# Altium project LLR-05U (Main-Board).PrjPcb
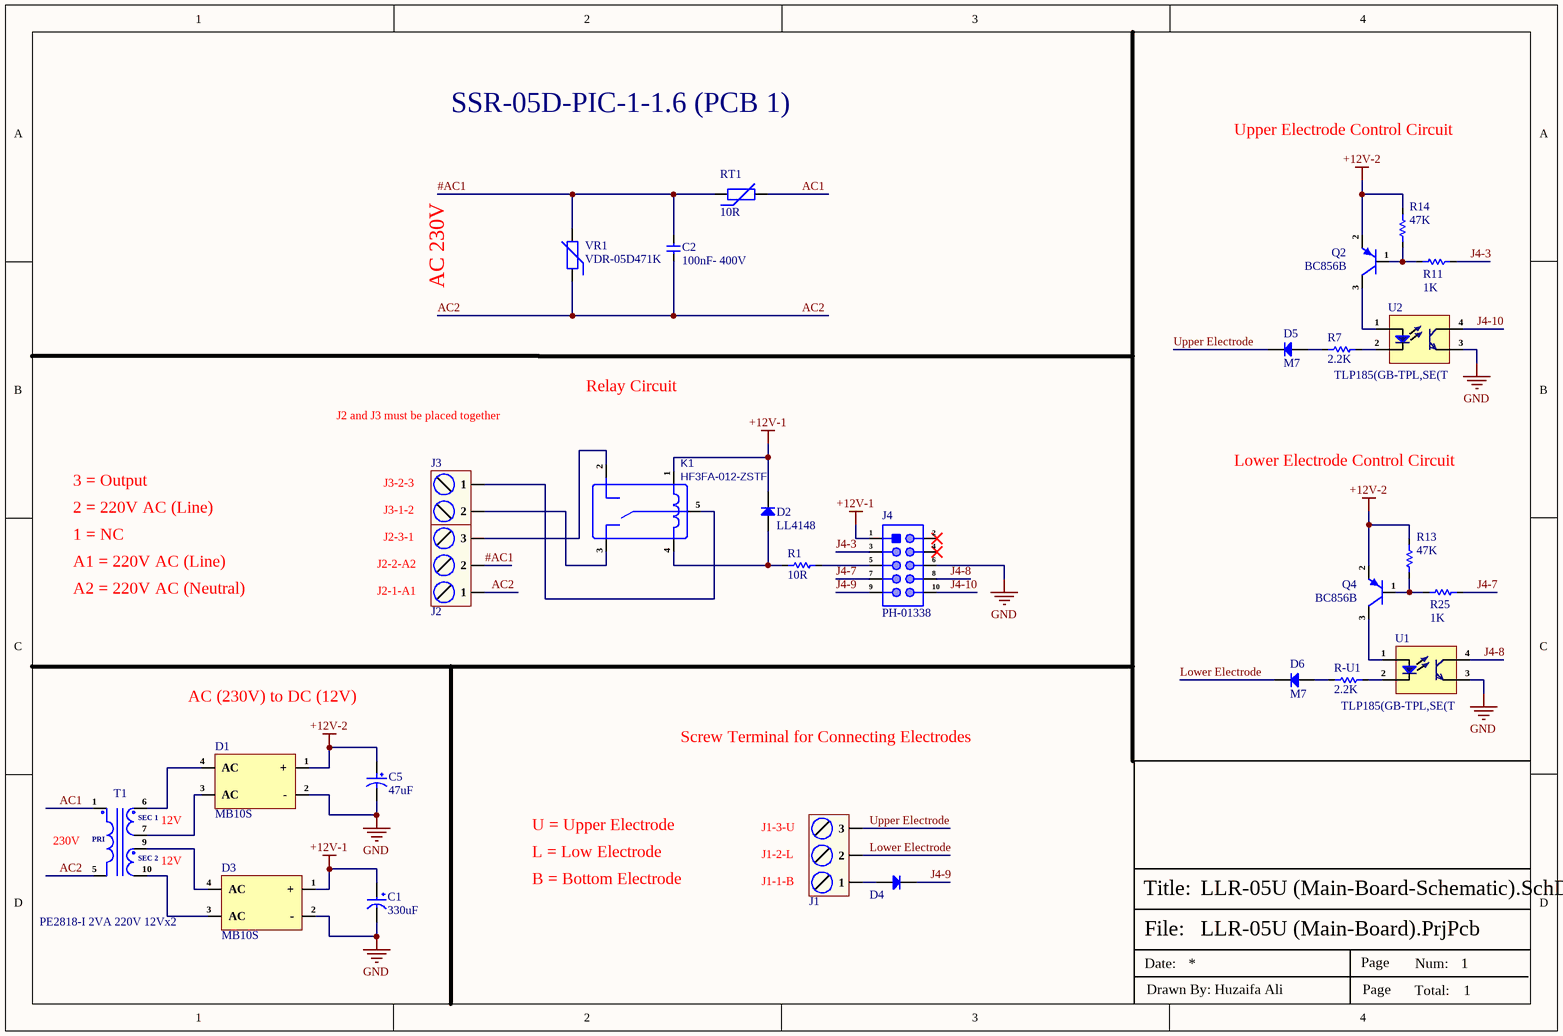
[diagram p0: LLR-05U (Main-Board-Schematic).SchDoc]
1 sheet, 28 parts. Net scope: global (net labels, ports and power ports of the same name join across sheets).
Board file: LLR-05U (Main-Board-PCB).PcbDoc

## Sheet LLR-05U (Main-Board-Schematic).SchDoc
size A4; SheetNumber: 1; SheetTotal: 1

### Parts
C1  330uF  [RC035M331LO8*14TH-2A1E]
C2  100nF- 400V  [82CL0114]
C5  47uF  [Plugin,D6.3xL12mm]
D1  MB10S  [MBS10S]
D2  LL4148  [LL-34]
D3  MB10S  [MBS10S]
D4  M7  [SMA(DO-214AC)]  (value not drawn)
D5  M7  [SMA(DO-214AC)]
D6  M7  [SMA(DO-214AC)]
J1  KF129-5.08-3P  [KF129-5.08-3P]  (value not drawn)
J2  KF129-5.08-3P  [KF129-5.08-3P]  (value not drawn)
J3  KF129-5.08-2P  [KF129-5.08-2P]  (value not drawn)
J4  PH-01338  [PH-01338]
K1  HF3FA-012-ZSTF  [HF3FA-012-ZSTF]
Q2  BC856B  [SOT-23]
Q4  BC856B  [SOT-23]
R1  10R  [RES-0805]
R7  2.2K  [Res-1206]
R11  1K  [Res-0603]
R13  47K  [Res-0603]
R14  47K  [Res-0603]
R25  1K  [Res-0603]
R-U1  2.2K  [Res-1206]
RT1  10R  [10D-9]
T1  PE2818-I 2VA 220V 12Vx2  [PE2818-I]
U1  TLP185(GB-TPL,SE(T  [SOP-4_2.54]
U2  TLP185(GB-TPL,SE(T  [SOP-4_2.54]
VR1  VDR-05D471K  [VDR-05D471K]

### Nets
+12V-1: C1.1 D2.1(K) D3.1(+) J4.1 K1.1
+12V-2: C5.1 D1.1(+) Q2.2(E) Q4.2(E) R13.2 R14.1
GND: C1.2 C5.2 D1.2(-) D3.2(-) J4.6 U1.3(E) U2.3(E)
#AC1: C2.2 J2.2 RT1.1 VR1.2
AC1: RT1.2 T1.1
AC2: C2.1 J2.1 T1.5 VR1.1
J4-3: J4.3 R11.2
J4-7: J4.7 R25.1
J4-8: J4.8 U1.4(C)
J4-9: D4.1(K) J4.9
J4-10: J4.10 U2.4(C)
Lower Electrode: D6.1(K) J1.2
Upper Electrode: D5.1(K) J1.3
NetD1_3: D1.3(AC) T1.7
NetD1_4: D1.4(AC) T1.6
NetD2_2: D2.2(A) K1.4 R1.2
NetD3_3: D3.3(AC) T1.10
NetD3_4: D3.4(AC) T1.9
NetD4_2: D4.2(A) J1.1
NetD5_2: D5.2(A) R7.1
NetD6_2: D6.2(A) R-U1.1
NetJ2_3: J2.3 K1.2
NetJ3_1: J3.1 K1.5
NetJ3_2: J3.2 K1.3
NetJ4_5: J4.5 R1.1
NetQ2_1: Q2.1(B) R11.1 R14.2
NetQ2_3: Q2.3(C) U2.1(An)
NetQ4_1: Q4.1(B) R13.1 R25.2
NetQ4_3: Q4.3(C) U1.1(An)
NetR7_2: R7.2 U2.2(Ca)
NetR-U1_2: R-U1.2 U1.2(Ca)

Not connected (* = marked no-connect by the designer): J4 2* 4*

### Notes on the sheet
- SSR-05D-PIC-1-1.6 (PCB 1)
- Upper Electrode Control Circuit
- AC 230V
- J2 and J3 must be placed together
- Relay Circuit
- 2 = 220V AC (Line)
- 3 = Output
- J3-1-2
- J3-2-3
- Lower Electrode Control Circuit
- A1 = 220V AC (Line)
- 1 = NC
- J2-2-A2
- J2-3-1
- A2 = 220V AC (Neutral)
- (near J2) J2-1-A1
- AC (230V) to DC (12V)
- Screw Terminal for Connecting Electrodes
- (near T1) 230V
- 12V
- U = Upper Electrode
- (near J1) J1-3-U
- (near T1) 12V
- L = Low Electrode
- B = Bottom Electrode
- (near J1) J1-2-L
- (near J1) J1-1-B
- File:
- Title:
- Date:
- Page
- Num:
- Total:
- Drawn By: Huzaifa Ali
- (in symbol PE2818-I 2VA 220V 12Vx2) SEC 1; PRI; SEC 2

### Library data of the parts
C1 = RC035M331LO8*14TH-2A1E: 330uF 35V ±20% 860mA@100kHz Plugin,D8xL14mm Aluminum Electrolytic Capacitors - Leaded ROHS; Manufacturer: BERYL Electronic Tech; Manufacturer Part Number: RC035M331LO8*14TH-2A1E; Package: Plugin,D8xL14mm; LCSC Part Number: C357626; Item Type: Capacitor; ComponentLink1Description: LCSC; ComponentLink1URL: https://www.lcsc.com/product-detail/Aluminum-Electrolytic-Capacitors-Leaded_BERYL-Electronic-Tech-RC035M331LO8-14TH-2A1E_C357626.html
C2 = 82CL0114: 5% 400V 100nF PET Plugin,P=7.5mm Film Capacitors ROHS; Manufacturer: KNSCHA; Manufacturer Part Number: 82CL0114; Package: Plugin,P=7.5mm; LCSC Part Number: C5359295; ComponentLink1Description: LCSC; ComponentLink1URL: https://www.lcsc.com/product-detail/Film-Capacitors_KNSCHA-82CL0114_C5359295.html
C5 = 03EC0571: 47uF 50V ±20% 180mA@100kHz Plugin,D6.3xL12mm Aluminum Electrolytic Capacitors - Leaded ROHS; Manufacturer: KNSCHA; Manufacturer Part Number: 03EC0571; Package: Plugin,D6.3xL12mm; LCSC Part Number: C2831773; Item Type: Capacitor; ComponentLink1Description: LCSC; ComponentLink1URL: https://www.lcsc.com/product-detail/Aluminum-Electrolytic-Capacitors-Leaded_KNSCHA-03EC0571_C2831773.html
D1 D3 = MB10S: 35A 1.1V@400mA 1A 1kV MBS Bridge Rectifiers ROHS; Manufacturer: MDD; Manufacturer Part Number: MB10S; Package: MBS; JLCPCB Part Number: C2488; Item Type: Bridge Rectifier; ComponentLink1Description: LCSC; ComponentLink1URL: https://www.lcsc.com/product-detail/Bridge-Rectifiers_MCC_MB6S-TP_MB6S-TP_C85619.html?gclid=CjwKCAjwjOunBhB4EiwA94JWsPhP5VxdRhkKtNAXxaeRo8Kbw1z5VNRY74bvbkYd4a4LtLXYHGrsEhoCPX4QAvD_BwE
D2 = LL4148: 75V 1V@10mA 4ns 200mA LL-34 Switching Diode ROHS; Manufacturer: MDD; Manufacturer Part Number: LL4148; Package: LL-34; LCSC Part Number: C435829; Item Type: Diode; ComponentLink1Description: LCSC; ComponentLink1URL: https://www.lcsc.com/product-detail/Switching-Diode_MDD-Microdiode-Electronics-LL4148_C435829.html
D4-D6 = M7: 1A 1.1V@1A 1kV DO-214AC Diodes - General Purpose ROHS; Manufacturer: MSKSEMI; Item Type: Diode; Manufacturer Part Number: M7; Package: DO-214AC; LCSC Part Number: C2902910; ComponentLink1Description: LCSC; ComponentLink1URL: https://www.lcsc.com/product-detail/Diodes-General-Purpose_MSKSEMI-M7_C2902910.html
J1 J2 = KF129-5.08-3P: 1x3P 24A -40℃~+105℃ 250V Green 12~24 Straight 5.08mm 2.5 1 3 Plugin,P=5.08mm Screw terminal ROHS; Manufacturer: CiXi KaiFeng Electronics; Supplier: LCSC; LCSC Part Number: C475093; Manufacturer Part Number: KF129-5.08-3P; RoHS: No; Item Type: Screw Terminal
J3 = KF129-5.08-2P: 1x2P 24A -40℃~+105℃ 250V Green 12~24 Straight 5.08mm 2.5 1 2 Plugin,P=5.08mm Screw terminal ROHS; Manufacturer: CiXi KaiFeng Electronics; Supplier: LCSC; LCSC Part Number: C475092; Manufacturer Part Number: KF129-5.08-2P; RoHS: No; Item Type: Screw terminal
J4 = PH-01338: 3A Straight Square Pins 10P 3mm -40℃~+105℃ 3mm 2.54mm 双排 Black 2x5P 2.54mm Plugin,P=2.54mm Pin Headers ROHS; Manufacturer: Liansheng; Manufacturer Part Number: PH-01338; Package: Plugin,P=2.54mm; LCSC Part Number: C2685218; Item Type: Pin Header; ComponentLink1Description: LCSC; ComponentLink1URL: https://www.lcsc.com/product-detail/Pin-Headers_Liansheng-PH-01338_C2685218.html
K1 = HF3FA-012-ZSTF: 12V SPDT (1 Form C) Plugin,15.2x19mm Power Relays ROHS; Manufacturer: HF(宏发); Item Type: Relay; Supplier: LCSC; LCSC Part Number: C190455; Manufacturer Part: HF3FA-012-ZSTF
Q2 Q4 = BC856B: 65V 200mW 220@2mA,5V 100mA PNP SOT-23 Bipolar Transistors - BJT ROHS; Manufacturer: Guangdong Hottech; Manufacturer Part Number: BC856B; Package: SOT-23; LCSC Part Number: C181144; Item Type: Transistors; ComponentLink1Description: LCSC; ComponentLink1URL: https://www.lcsc.com/product-detail/Bipolar-Transistors-BJT_Guangdong-Hottech-BC856B_C181144.html
R1 = 0805W8F100JT5E: 125mW Thick Film Resistors 150V ±1% ±200ppm/℃ 10Ω 0805 Chip Resistor - Surface Mount ROHS; Manufacturer: Royal Electronic Factory; Supplier: Mouser; LCSC Part Number: C17415; Manufacturer Part Number: 0805W8F100JT5E; RoHS: No; Item Type: Resistor; Stock: 270000; Pricing: 10000=0.002 (USD); Value: 10R
R7 R-U1 = 1206W4F2201T5E: 250mW Thick Film Resistors 200V ±100ppm/℃ ±1% 2.2kΩ 1206 Chip Resistor - Surface Mount ROHS; Manufacturer: Uniroyal; Supplier: LCSC; LCSC Part Number: C17948; Manufacturer Part Number: 1206W4F2201T5E; RoHS: Yes; Category: LDO; RoHS Compliant: Yes; Item Type: Resistor
R11 R25 = RT0603BRD071KL: RES SMD 1K OHM 0.1% 1/10W 0603; Manufacturer: Yageo; Resistance: 1kR; Power Rating: 100mW; Voltage Rating: 75V; Temperature Coefficient: 25ppm/°C; Voltage Rating (DC): 50V; Item Type: Resistor; Supplier 1: Arrow Electronics; Manufacturer Part Number: RT0603BRD071KL; RoHS: Yes; Category: Chip SMD Resistors; Stock 1: 130000; Pricing 1: 5000=0.03900, 10000=0.03450, 25000=0.03070, 50000=0.02040 (USD); Mount: Surface Mount; Case/Package: 0603; Case Code (Metric): 1608; Case Code (Imperial): 0603; Contact Plating: Tin,Lead; Size Code: 0603; Min Operating Temperature: -55°C; Max Operating Temperature: 125°C; Package Quantity: 5000; Packaging: Tape and Reel; Resistor Type: Thin Film; Number of Terminations: 2; Termination: SMD/SMT; Max Power Dissipation: 100mW; Features: Moisture Resistant; Series: RT; Technology: THIN FILM; Construction: Rectangular; Length: 1.6mm; Width: 0.031inch; Height: 0.022inch; Depth: 0.8mm; Military Standard: Not; Lead Free: Lead Free; RoHS Compliant: Yes; ComponentLink1URL: https://datasheet.ciiva.com/11819/0900766b8079c86e-11819652.pdf?src-supplier=RSComponents; ComponentLink1Description: https://datasheet.ciiva.com/11819/0900766b8079c86e-11819652.pdf?src-supplier=RSComponents; ComponentLink2URL: https://datasheet.ciiva.com/5624/pyu-rt-1-to-0-05-rohs-l-4-5624759.pdf?src-supplier=Mouser; ComponentLink2Description: https://datasheet.ciiva.com/5624/pyu-rt-1-to-0-05-rohs-l-4-5624759.pdf?src-supplier=Mouser; ComponentLink3URL: https://datasheet.ciiva.com/29718/pyu-rt-1-to-0-05-rohs-l-4-29718010.pdf?src-supplier=Digi-Key; ComponentLink3Description: https://datasheet.ciiva.com/29718/pyu-rt-1-to-0-05-rohs-l-4-29718010.pdf?src-supplier=Digi-Key; ComponentLink4URL: https://datasheet.ciiva.com/29718/pyu-rt-1-to-0-05-rohs-l-4-29718011.pdf?src-supplier=Digi-Key; ComponentLink4Description: https://datasheet.ciiva.com/29718/pyu-rt-1-to-0-05-rohs-l-4-29718011.pdf?src-supplier=Digi-Key; Supplier Part Number 1: RT0603BRD071KL; LCSC Part Number: C110776
R13 R14 = RT0603BRD0747KL: RES SMD 47K OHM 0.1% 1/10W 0603; Manufacturer: Yageo; Voltage Rating: 75V; Resistance: 47kR; Power Rating: 100mW; Temperature Coefficient: 25ppm/°C; Voltage Rating (DC): 50V; Item Type: Resistor; Supplier 1: Arrow Electronics; Manufacturer Part Number: RT0603BRD0747KL; RoHS: Yes; Category: Chip SMD Resistors; Stock 1: 5153; Pricing 1: 1=0.29190, 10=0.22910, 25=0.22680, 100=0.09530, 250=0.09440, 500=0.09340, 1000=0.04780, 3000=0.03070 (USD); Case/Package: 0603; Case Code (Metric): 1608; Case Code (Imperial): 0603; Contact Plating: Tin,Lead; Min Operating Temperature: -55°C; Max Operating Temperature: 125°C; Packaging: Tape and Reel; Package Quantity: 5000; Resistor Type: Thin Film; Termination: SMD/SMT; Number of Terminations: 2; Max Power Dissipation: 100mW; Features: Moisture Resistant; Series: RT; Construction: Rectangular; Length: 0.063inch; Width: 0.031inch; Height: 0.022inch; Depth: 0.8mm; Military Standard: Not; Lead Free: Lead Free; RoHS Compliant: Yes; ComponentLink1URL: https://datasheet.ciiva.com/2585/pyu-rt-1-to-0-05-rohs-l-4-2585964.pdf?src-supplier=Digi-Key; ComponentLink1Description: https://datasheet.ciiva.com/2585/pyu-rt-1-to-0-05-rohs-l-4-2585964.pdf?src-supplier=Digi-Key; ComponentLink2URL: https://datasheet.ciiva.com/46635/pyu-rt-1-to-0-05-rohs-l-5-46635309.pdf?src-supplier=Digi-Key; ComponentLink2Description: https://datasheet.ciiva.com/46635/pyu-rt-1-to-0-05-rohs-l-5-46635309.pdf?src-supplier=Digi-Key; Supplier Part Number 1: RT0603BRD0747KL; LCSC Part Number: C326725
RT1 = 10D-9: 10Ω 2A 2700K Plugin,P=7.5mm NTC Thermistors ROHS; Manufacturer: SURGING; Manufacturer Part Number: 10D-9; Package: Plugin,P=7.5mm; LCSC Part Number: C2839611; Item Type: NTC Thermistor; ComponentLink1Description: LCSC; ComponentLink1URL: https://www.lcsc.com/product-detail/NTC-Thermistors_SURGING-10D-9_C2839611.html
T1 = PE2818-I 2VA 220V 12Vx2: Power 2VA 220V / 6Vx2/7.5Vx2/9Vx2/12Vx2/15Vx2/18Vx2/24Vx2 Encapsulated For PCB Mounted Isolation Transformer; Manufacturer: YHDC; Manufacturer Part Number: PE2818-I; Item Type: Transformer; ComponentLink1Description: LCSC; ComponentLink1URL: https://vi.aliexpress.com/item/32737778653.html?gatewayAdapt=4itemAdapt
U1 U2 = TLP185(GB-TPL,SE(T: 80V 3.75kV 50mA 300mV@2.4mA,8mA 1 5V 1.25V DC SOP-4-2.54mm Transistor Output Optocoupler ROHS; Manufacturer: TOSHIBA; Manufacturer Part Number: TLP185(GB-TPL,SE(T; Package: SOP-4-2.54mm; LCSC Part Number: C7240; Item Type: Optocoupler; ComponentLink1Description: LCSC; ComponentLink1URL: https://www.lcsc.com/product-detail/Transistor-Output-Optocoupler_TOSHIBA-TLP185-GB-TPL-SE-T_C7240.html
VR1 = VDR-05D471K: 810V 385V 300V 423V~517V Plugin Varistors ROHS; Manufacturer: VDR Varistor; Manufacturer Part Number: VDR-05D471K; Package: Plugin; LCSC Part Number: C273543; Item Type: Varistors; ComponentLink1Description: LCSC; ComponentLink1URL: https://www.lcsc.com/product-detail/Varistors_VDR-span-style-background-color-ff0-Varistor-span-VDR-05D471K_C273543.html